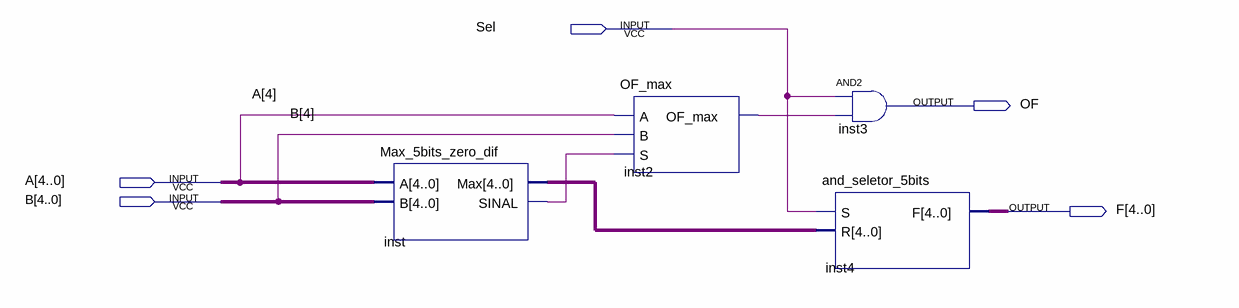
[diagram p0: schematic sheet]
// Quartus schematic BLOCO_max.bdf as structural Verilog: 4 symbols, 5 pins
module BLOCO_max (
  input  Sel,
  input  [4:0] A,
  input  [4:0] B,
  output OF,
  output [4:0] F
);

  wire inst2_of_max, inst_sinal;
  wire [4:0] inst_max;

  Max_5bits_zero_dif inst (.A(A), .B(B), .Max(inst_max), .SINAL(inst_sinal));
  OF_max inst2 (.A(A[4]), .B(B[4]), .S(inst_sinal), .OF_max(inst2_of_max));
  and inst3 (OF, Sel, inst2_of_max);
  and_seletor_5bits inst4 (.S(Sel), .R(inst_max), .F(F));
endmodule
